# Altium schematic sheet radar schematic 2.SchDoc
size A4; SheetNumber: 1; SheetTotal: 1
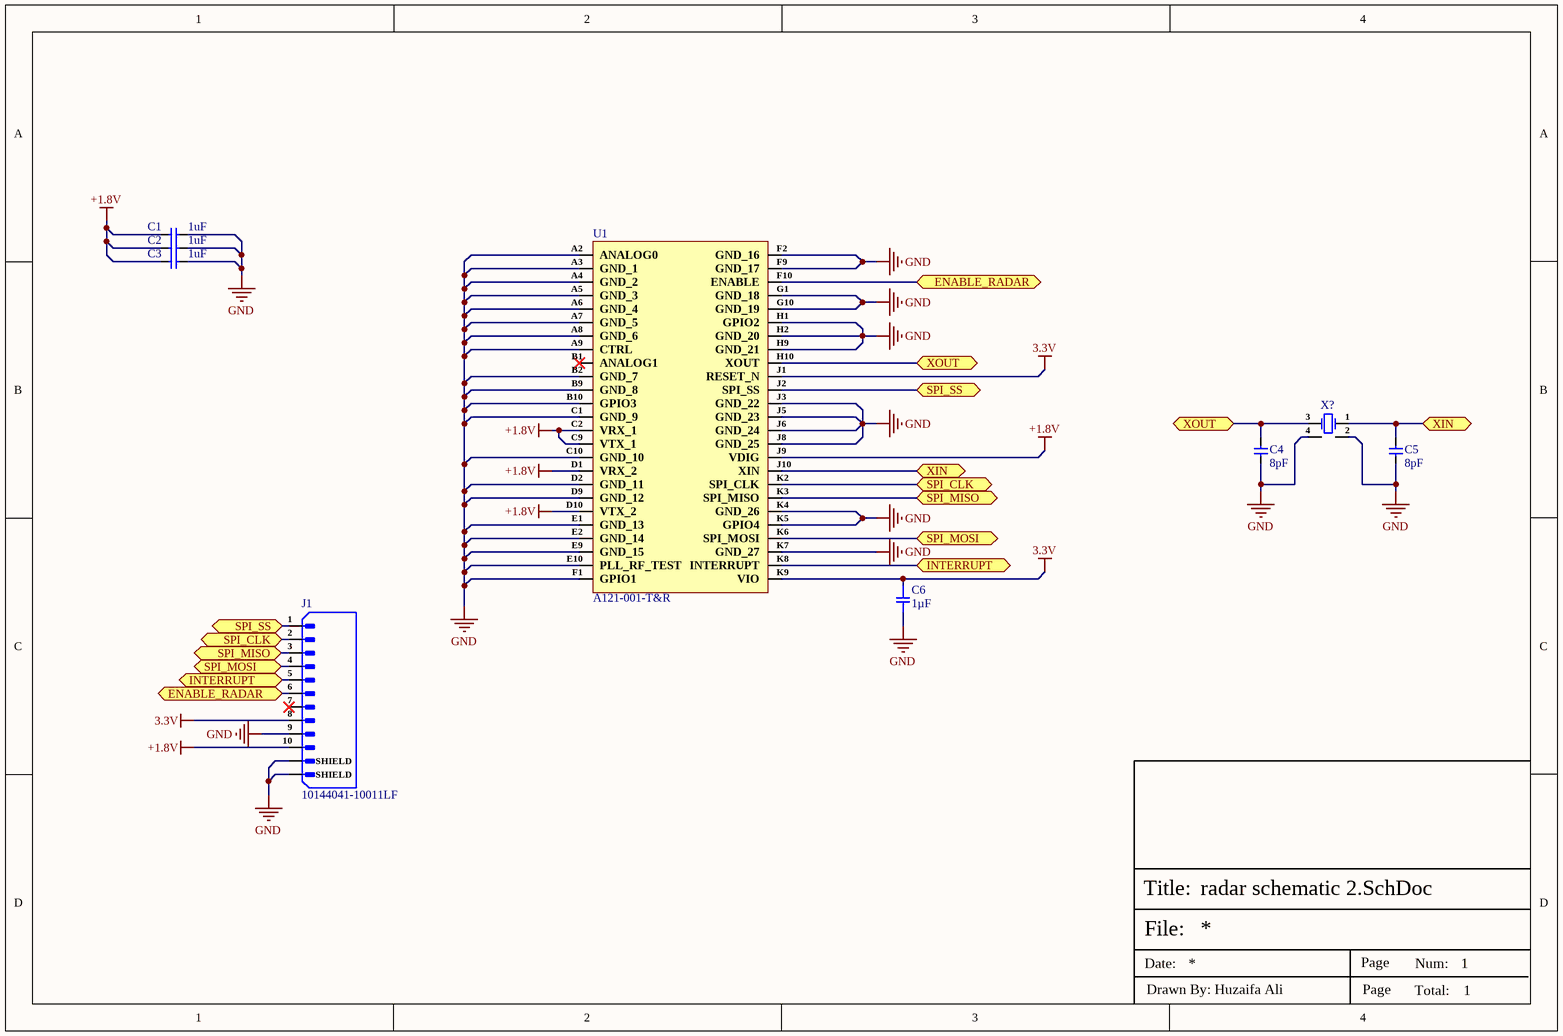
[diagram p0: radar schematic 2.SchDoc]

## Parts
C1  1uF  [Cap-0402]
C2  1uF  [Cap-0402]
C3  1uF  [Cap-0402]
C4  8pF  [Cap-0402]
C5  8pF  [Cap-0402]
C6  1µF  [SMD-0402C]
J1  10144041-10011LF  [10144041-10011LF]
U1  A121-001-T&R  [50-FCCSP (5.2x5.5)]
X?  ECS-240-8-36-RWN-TR3  [SMD2520-4P]  (value not drawn)

## Ports
ENABLE_RADAR (bidir, see radar schematic 2[1C]), ENABLE_RADAR (bidir, see radar schematic 2[3B]), INTERRUPT (bidir, see radar schematic 2[1C]), INTERRUPT (bidir, see radar schematic 2[3C]), SPI_CLK (bidir, see radar schematic 2[1C]), SPI_CLK (bidir, see radar schematic 2[3B]), SPI_MISO (bidir, see radar schematic 2[1C]), SPI_MISO (bidir, see radar schematic 2[3B]), SPI_MOSI (bidir, see radar schematic 2[1C]), SPI_MOSI (bidir, see radar schematic 2[3C]), SPI_SS (bidir, see radar schematic 2[1C]), SPI_SS (bidir, see radar schematic 2[3B]), XIN (bidir, see radar schematic 2[3B]), XIN (bidir, see radar schematic 2[4B]), XOUT (bidir, see radar schematic 2[3B]), XOUT (bidir, see radar schematic 2[4B])

## Nets
3.3V: C6.1 J1.8 U1.J1(RESET_N) U1.K9(VIO)
+1.8V: C1.1 C2.1 C3.1 J1.10 U1.C2(VRX_1) U1.C9(VTX_1) U1.D1(VRX_2) U1.D10(VTX_2) U1.J9(VDIG)
GND: C1.2 C2.2 C3.2 C4.1 C5.1 C6.2 J1.9 J1.S1(SHIELD) U1.A2(ANALOG0) U1.A3(GND_1) U1.A4(GND_2) U1.A5(GND_3) U1.A6(GND_4) U1.A7(GND_5) U1.A8(GND_6) U1.A9(CTRL) U1.B2(GND_7) U1.B9(GND_8) U1.B10(GPIO3) U1.C1(GND_9) U1.C10(GND_10) U1.D2(GND_11) U1.D9(GND_12) U1.E1(GND_13) U1.E2(GND_14) U1.E9(GND_15) U1.E10(PLL_RF_TEST) U1.F1(GPIO1) U1.F2(GND_16) U1.F9(GND_17) U1.G1(GND_18) U1.G10(GND_19) U1.H1(GPIO2) U1.H2(GND_20) U1.H9(GND_21) U1.J3(GND_22) U1.J5(GND_23) U1.J6(GND_24) U1.J8(GND_25) U1.K4(GND_26) U1.K5(GPIO4) U1.K7(GND_27) X?.2(GND) X?.4(GND)
ENABLE_RADAR: J1.6 U1.F10(ENABLE) ; port ENABLE_RADAR
INTERRUPT: J1.5 U1.K8(INTERRUPT) ; port INTERRUPT
SPI_CLK: J1.2 U1.K2(SPI_CLK) ; port SPI_CLK
SPI_MISO: J1.3 U1.K3(SPI_MISO) ; port SPI_MISO
SPI_MOSI: J1.4 U1.K6(SPI_MOSI) ; port SPI_MOSI
SPI_SS: J1.1 U1.J2(SPI_SS) ; port SPI_SS
XIN: C5.2 U1.J10(XIN) X?.1(IN/OUT) ; port XIN
XOUT: C4.2 U1.H10(XOUT) X?.3(Out/In) ; port XOUT

Not connected (* = marked no-connect by the designer): J1 7*; U1 B1(ANALOG1)*

## Notes on the sheet
- File:
- Title:
- Date:
- Page
- Num:
- Total:
- Drawn By: Huzaifa Ali

## Library data of the parts
C1-C3 = CC0402KRX5R6BB105: CAP CER 1UF 10V X5R 0402; Manufacturer: Yageo; Tolerance: 10%; Dissipation Factor: 15%; Item Type: Capacitor; Supplier 1: Mouser; Manufacturer Part Number: CC0402KRX5R6BB105; RoHS: Yes; Category: Ceramic Capacitors; Stock 1: 6711367; Pricing 1: 1=0.11000, 10=0.05500, 50=0.05500, 100=0.03300, 500=0.02700, 1000=0.02200, 2500=0.02100, 10000=0.01800 (USD); Mount: Surface Mount; Case/Package: 0402; Number of Pins: 2; Case Code (Metric): 1005; Case Code (Imperial): 0402; Min Operating Temperature: -55°C; Max Operating Temperature: 85°C; Capacitance: 1uF; Dielectric: X5R; Package Quantity: 1; Voltage Rating: 10V; Packaging: Tape and Reel; Voltage Rating (DC): 10V; Termination: SMD/SMT; Resistor Type: Ceramic; Series: CC; Construction: Flat; Length: 1mm; Width: 0.02inch; Height: 0.5mm; Thickness: 0.022inch; Depth: 0.5mm; Radiation Hardening: No; REACH SVHC: No SVHC; Lead Free: Lead Free; Halogen Free: Halogen Free; RoHS Compliant: Yes; ComponentLink1URL: https://datasheet.ciiva.com/176/upy-gphc-x5r-4v-to-50v-12-176704.pdf?src-supplier=Digi-Key; ComponentLink1Description: https://datasheet.ciiva.com/176/upy-gphc-x5r-4v-to-50v-12-176704.pdf?src-supplier=Digi-Key; ComponentLink2URL: https://datasheet.ciiva.com/176/mlccorderingcode-176705.pdf?src-supplier=Digi-Key; ComponentLink2Description: https://datasheet.ciiva.com/176/mlccorderingcode-176705.pdf?src-supplier=Digi-Key; ComponentLink3URL: https://datasheet.ciiva.com/176/mlccorderingcode-176706.pdf?src-supplier=Digi-Key; ComponentLink3Description: https://datasheet.ciiva.com/176/mlccorderingcode-176706.pdf?src-supplier=Digi-Key; Supplier Part Number 1: 603-CC402KRX5R6BB105; LCSC Part Number: C106254
C4 C5 = 0402CG8R0C500NT: 50V 8pF C0G 0402 Multilayer Ceramic Capacitors MLCC - SMD/SMT ROHS; Manufacturer: FH (Guangdong Fenghua Advanced Tech); Manufacturer Part Number: 0402CG8R0C500NT; Package: 0402; LCSC Part Number: C1578; Item Type: Capacitor; ComponentLink1Description: LCSC; ComponentLink1URL: https://www.lcsc.com/product-detail/Multilayer-Ceramic-Capacitors-MLCC-SMD-SMT_FH-Guangdong-Fenghua-Advanced-Tech-0402CG8R0C500NT_C1578.html
C6 = GCM155C71A105KE38D: CAP CER 1UF 10V X7S 0402; Manufacturer: Murata Electronics North America; Factory Stock: 0; Unit Price (USD): 0.12; Minimum Quantity: 1; Tolerance: ±10%; Datasheets: http://www.murata.com/~/media/webrenewal/support/library/catalog/products/capacitor/mlcc/c03e.ashx; Image: //media.digikey.com/Renders/Murata%20Renders/ZRB-SERIES-0402.jpg; Digi-Key Part Number: 490-13409-1-ND; Part Number: GCM155C71A105KE38D; Quantity Available: 7240; @ qty: 0; Packaging: Cut Tape (CT); Series: GCM; Part Status: Active; Value: 1µF; Voltage: 10V; Temperature Coefficient: X7S; Operating Temperature: -55°C ~ 125°C; Features: -; Ratings: AEC-Q200; Applications: Automotive; Mounting Type: Surface Mount, MLCC; Package / Case: 0402 (1005 Metric); Size / Dimension: 0.039" L x 0.020" W (1.00mm x 0.50mm); Height - Seated (Max): -; Thickness (Max): 0.022" (0.55mm); Lead Spacing: -; Lead Style: -
J1 = 10144041-10011LF: CONN HEADER SMD R/A 10POS 0.8MM; Manufacturer: Amphenol ICC (FCI); Item Type: Right Angle Connector; Package: Custom; Manufacturer Part Number: 10144041-10011LF
U1 = A121-001-T&R: RADAR SENSOR SYSTEM-IN-PACKAGE B; Manufacturer: Acconeer; Item Type: IC; Supplier: Mouser; Supplier Part Number: 925-A121-001-T&R; Manufacturer Part Number: A121-001-T&R; RoHS: No; Category: LDO; Stock: 7442; Pricing: 1=13.72, 10=11.57, 50=10.22, 100=8.78, 1000=7.74, 10000=6.41 (USD)
X? = ECS-240-8-36-RWN-TR3: CRYSTAL 24.0000MHZ 8PF SMD; Manufacturer: ECS Inc.; Package: None; Manufacturer Part Number: ECS-240-8-36-RWN-TR3; Item Type: Crystal